# Altium schematic sheet Bay_holder.SchDoc
size A4; SheetNumber: 7; SheetTotal: 8
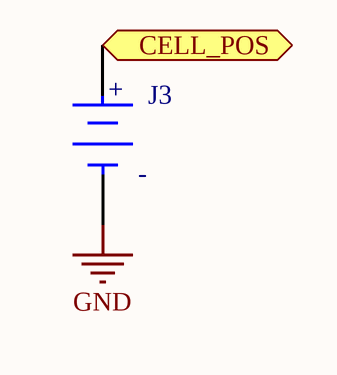
[diagram p0: Bay_holder.SchDoc]

## Parts
J3  1043P  [FP-1043P-MFG]  (value not drawn)

## Ports
CELL_POS (bidir)

## Nets
GND: J3.1(C)
CELL_POS: J3.2(A) ; port CELL_POS

## Notes on the sheet
- (in symbol CMP-19636-000034-1) +

## Library data of the parts
J3 = CMP-19636-000034-1: BATT HOLDER 18650 1 CELL PC PIN; Number of Cells: 1; Series: -; Termination: PC Pin; Package Quantity: 50; Min Operating Temperature: -50°C; Mount: Through Hole; Packaging: Tray; Max Operating Temperature: 145°C